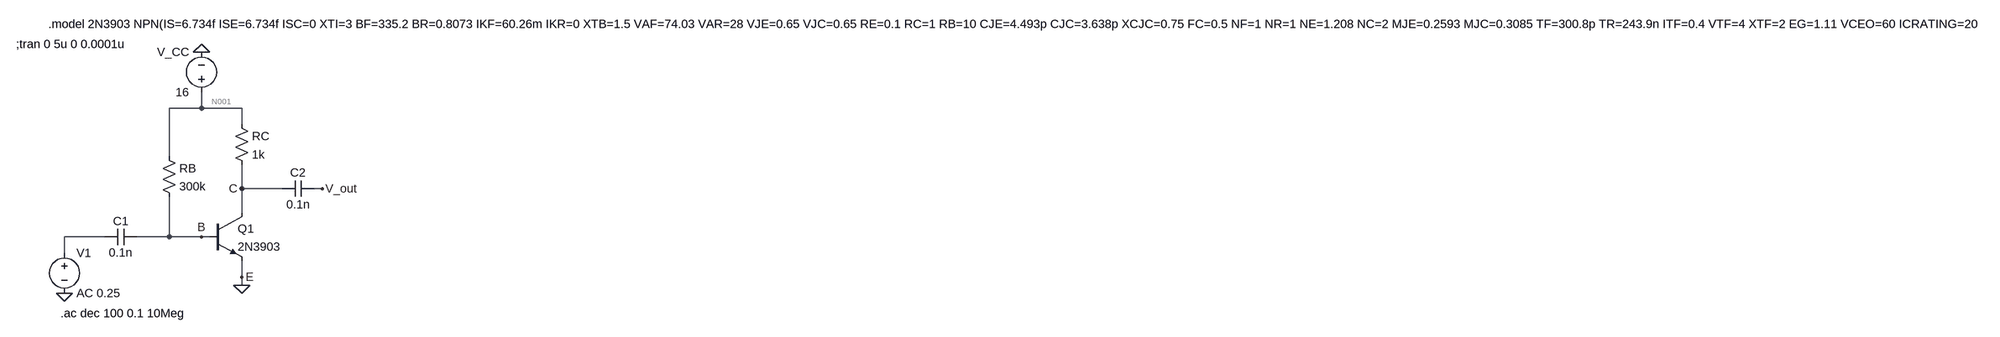
[diagram p0: schematic bjt_smallsigamp.asc]
bjt_smallsigamp.asc, the LTspice schematic file:
Version 4
SHEET 1 4196 1128
WIRE 240 -64 240 -96
WIRE 240 -64 176 -64
WIRE 320 -64 240 -64
WIRE 320 -32 320 -64
WIRE 176 32 176 -64
WIRE 320 96 320 48
WIRE 400 96 320 96
WIRE 480 96 464 96
WIRE 320 144 320 96
WIRE 48 192 -32 192
WIRE 176 192 176 112
WIRE 176 192 112 192
WIRE 240 192 176 192
WIRE 256 192 240 192
WIRE -32 224 -32 192
WIRE 320 272 320 240
WIRE 320 288 320 272
FLAG 320 288 0
FLAG 320 96 C
FLAG 320 272 E
FLAG 240 192 B
FLAG 240 -176 0
FLAG 480 96 V_out
FLAG -32 304 0
SYMBOL npn 256 144 R0
SYMATTR InstName Q1
SYMATTR Value 2N3903
SYMBOL cap 112 176 R90
WINDOW 0 0 32 VBottom 2
WINDOW 3 32 32 VTop 2
SYMATTR InstName C1
SYMATTR Value 0.1n
SYMBOL cap 464 80 R90
WINDOW 0 0 32 VBottom 2
WINDOW 3 32 32 VTop 2
SYMATTR InstName C2
SYMATTR Value 0.1n
SYMBOL res 160 16 R0
SYMATTR InstName RB
SYMATTR Value 300k
SYMBOL res 304 -48 R0
SYMATTR InstName RC
SYMATTR Value 1k
SYMBOL voltage 240 -80 R180
WINDOW 0 24 96 Left 2
WINDOW 3 24 16 Left 2
SYMATTR InstName V_CC
SYMATTR Value 16
SYMBOL voltage -32 208 R0
SYMATTR InstName V1
SYMATTR Value AC 0.25
TEXT -40 344 Left 2 !.ac dec 100 0.1 10Meg
TEXT -128 -192 Left 2 !;tran 0 5u 0 0.0001u
TEXT -64 -232 Left 2 !.model 2N3903 NPN(IS=6.734f ISE=6.734f ISC=0 XTI=3 BF=335.2 BR=0.8073 IKF=60.26m IKR=0 XTB=1.5 VAF=74.03 VAR=28 VJE=0.65 VJC=0.65 RE=0.1 RC=1 RB=10 CJE=4.493p CJC=3.638p XCJC=0.75 FC=0.5 NF=1 NR=1 NE=1.208 NC=2 MJE=0.2593 MJC=0.3085 TF=300.8p TR=243.9n ITF=0.4 VTF=4 XTF=2 EG=1.11 VCEO=60 ICRATING=200M MFG=NSC)

The netlist it stands for:
* bjt_smallsigamp.asc
Q1 C B 0 0 2N3903
C1 B N002 0.1n
C2 V_out C 0.1n
RB N001 B 300k
RC N001 C 1k
V_CC N001 0 16
V1 N002 0 AC 0.25
.model NPN NPN
.model PNP PNP
.lib standard.bjt
.ac dec 100 0.1 10Meg
;tran 0 5u 0 0.0001u
.model 2N3903 NPN(IS=6.734f ISE=6.734f ISC=0 XTI=3 BF=335.2 BR=0.8073 IKF=60.26m IKR=0 XTB=1.5 VAF=74.03 VAR=28 VJE=0.65 VJC=0.65 RE=0.1 RC=1 RB=10 CJE=4.493p CJC=3.638p XCJC=0.75 FC=0.5 NF=1 NR=1 NE=1.208 NC=2 MJE=0.2593 MJC=0.3085 TF=300.8p TR=243.9n ITF=0.4 VTF=4 XTF=2 EG=1.11 VCEO=60 ICRATING=200M MFG=NSC)
.backanno
.end

* Results of the author's LTspice run, read from the files saved beside the schematic
* Operating Point, zero values left out:
*   V(c) = 11.64 V
*   V(b) = 703 mV
*   V(n001) = 16 V
*   Ic(Q1) = 4.365 mA
*   Ib(Q1) = 50.99 µA
*   Ie(Q1) = -4.416 mA
*   I(Rc) = 4.365 mA
*   I(Rb) = 50.99 µA
*   I(V_cc) = -4.416 mA
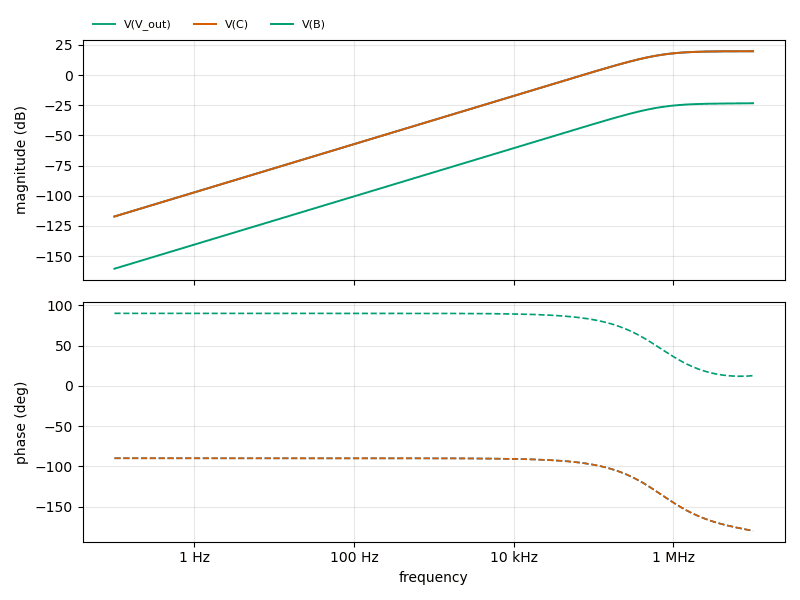
[diagram p1: AC Analysis of bjt_smallsigamp.asc, plotted from the saved traces]
* AC Analysis, 1 run:
*   V(V_out): -117.20 dB at 100 mHz, 19.82 dB at 10 MHz, peak 19.82 dB at 10 MHz, 3 dB below the peak at 706.2 kHz
*   V(C): -117.20 dB at 100 mHz, 19.82 dB at 10 MHz, peak 19.82 dB at 10 MHz, 3 dB below the peak at 706.2 kHz
*   V(B): -160.50 dB at 100 mHz, -23.29 dB at 10 MHz, peak -23.29 dB at 10 MHz, 3 dB below the peak at 738.1 kHz